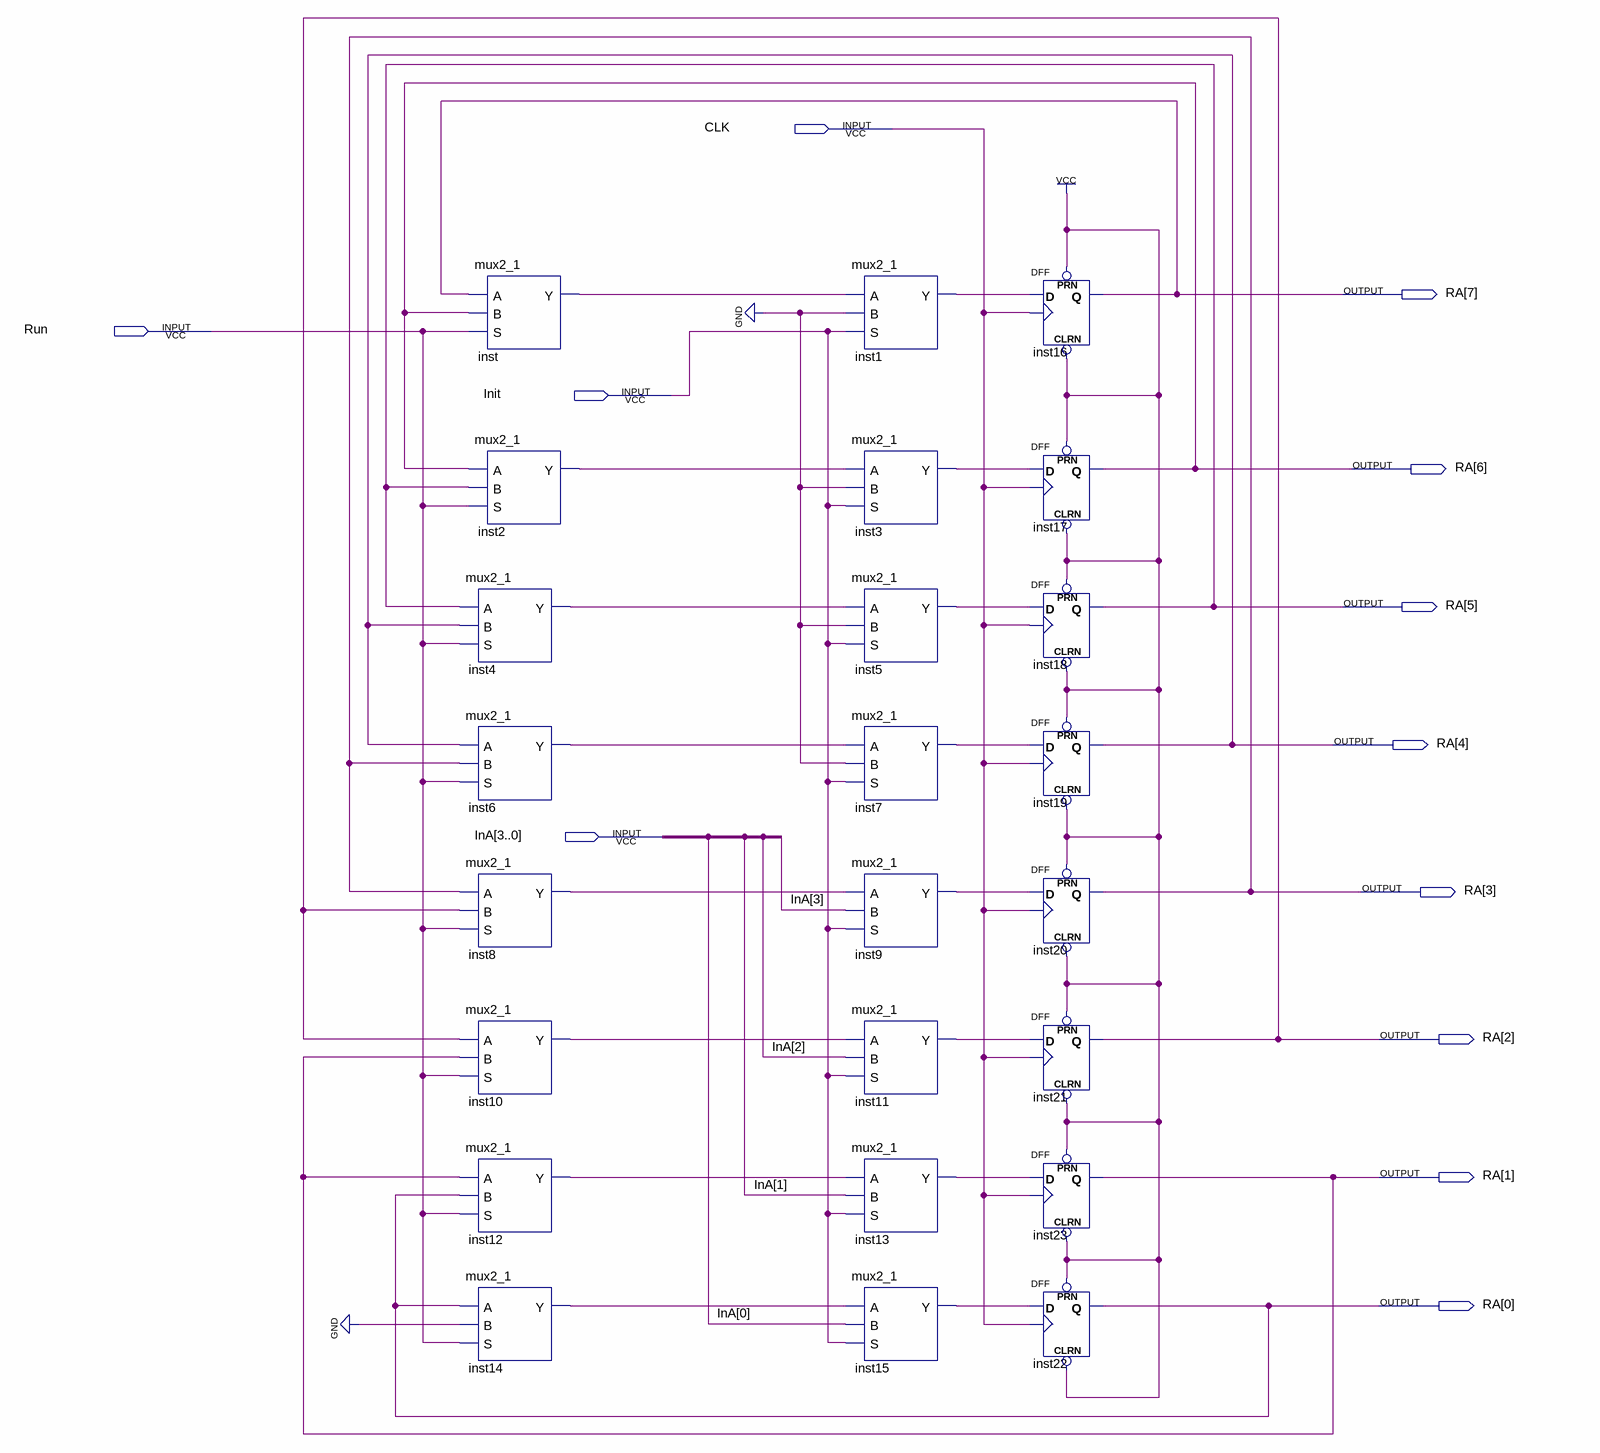
[diagram p0: schematic sheet]
// Quartus schematic RegA.bdf as structural Verilog: 24 symbols, 12 pins
module RegA (
  input  CLK,
  input  Run,
  input  Init,
  input  [3:0] InA,
  output [7:0] RA
);

  wire inst1_y, inst2_y, inst3_y, inst4_y, inst5_y, inst6_y, inst7_y, inst8_y, inst9_y, inst10_y, inst11_y,
       inst12_y, inst13_y, inst14_y, inst15_y, inst_y;

  mux2_1 inst (.A(RA[7]), .B(RA[6]), .S(Run), .Y(inst_y));
  mux2_1 inst2 (.A(RA[6]), .B(RA[5]), .S(Run), .Y(inst2_y));
  mux2_1 inst4 (.A(RA[5]), .B(RA[4]), .S(Run), .Y(inst4_y));
  mux2_1 inst6 (.A(RA[4]), .B(RA[3]), .S(Run), .Y(inst6_y));
  mux2_1 inst8 (.A(RA[3]), .B(RA[2]), .S(Run), .Y(inst8_y));
  mux2_1 inst10 (.A(RA[2]), .B(RA[1]), .S(Run), .Y(inst10_y));
  mux2_1 inst12 (.A(RA[1]), .B(RA[0]), .S(Run), .Y(inst12_y));
  mux2_1 inst14 (.A(RA[0]), .B(1'b0), .S(Run), .Y(inst14_y));
  mux2_1 inst1 (.A(inst_y), .B(1'b0), .S(Init), .Y(inst1_y));
  mux2_1 inst3 (.A(inst2_y), .B(1'b0), .S(Init), .Y(inst3_y));
  mux2_1 inst5 (.A(inst4_y), .B(1'b0), .S(Init), .Y(inst5_y));
  mux2_1 inst7 (.A(inst6_y), .B(1'b0), .S(Init), .Y(inst7_y));
  mux2_1 inst9 (.A(inst8_y), .B(InA[3]), .S(Init), .Y(inst9_y));
  mux2_1 inst11 (.A(inst10_y), .B(InA[2]), .S(Init), .Y(inst11_y));
  mux2_1 inst13 (.A(inst12_y), .B(InA[1]), .S(Init), .Y(inst13_y));
  mux2_1 inst15 (.A(inst14_y), .B(InA[0]), .S(Init), .Y(inst15_y));
  DFF inst16 (.CLRN(1'b1), .CLK(CLK), .D(inst1_y), .PRN(1'b1), .Q(RA[7]));
  DFF inst17 (.CLRN(1'b1), .CLK(CLK), .D(inst3_y), .PRN(1'b1), .Q(RA[6]));
  DFF inst18 (.CLRN(1'b1), .CLK(CLK), .D(inst5_y), .PRN(1'b1), .Q(RA[5]));
  DFF inst19 (.CLRN(1'b1), .CLK(CLK), .D(inst7_y), .PRN(1'b1), .Q(RA[4]));
  DFF inst20 (.CLRN(1'b1), .CLK(CLK), .D(inst9_y), .PRN(1'b1), .Q(RA[3]));
  DFF inst21 (.CLRN(1'b1), .CLK(CLK), .D(inst11_y), .PRN(1'b1), .Q(RA[2]));
  DFF inst23 (.CLRN(1'b1), .CLK(CLK), .D(inst13_y), .PRN(1'b1), .Q(RA[1]));
  DFF inst22 (.CLRN(1'b1), .CLK(CLK), .D(inst15_y), .PRN(1'b1), .Q(RA[0]));
endmodule
